# Altium project Smart-garden-pcb-V2.PrjPcb
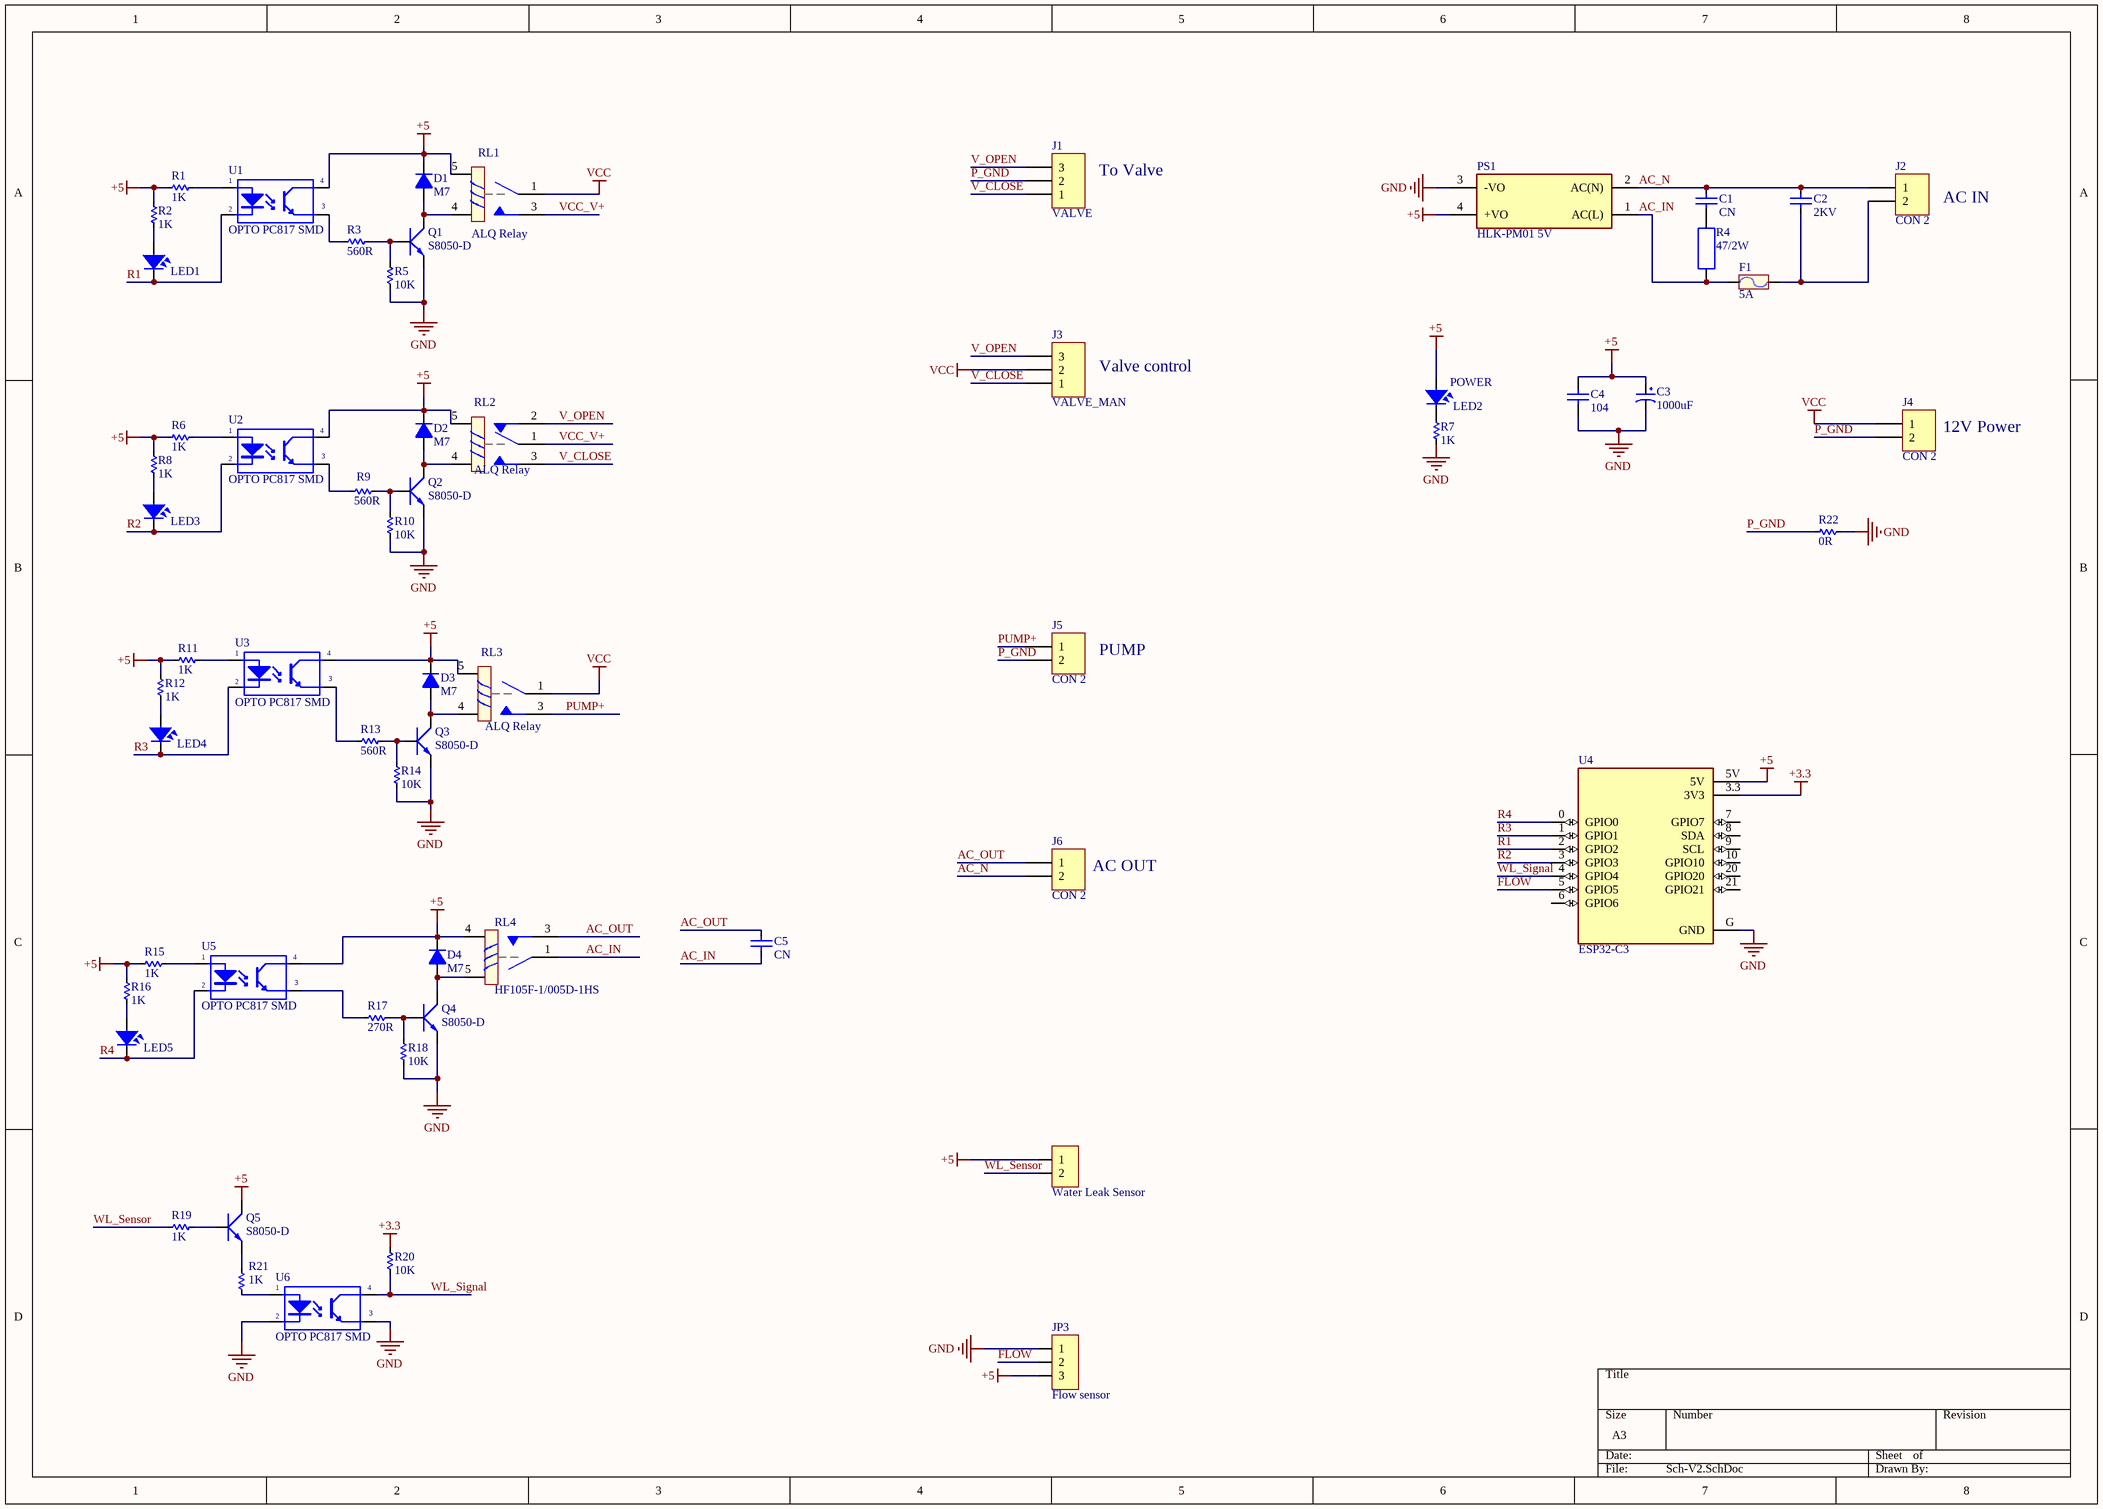
[diagram p0: Sch-V2.SchDoc]
1 sheet, 61 parts. Net scope: global (net labels, ports and power ports of the same name join across sheets).
Board file: PCB-V2.PcbDoc

## Sheet Sch-V2.SchDoc
size A3; SheetNumber: 1; SheetTotal: 1

### Parts
C1  CN  [Cap 10mm]
C2  2KV  [Cap 7.5mm]
C3  1000uF  [tu hoa 8mm]
C4  104  [tu 1206]
C5  CN  [Cap 10mm]
D1  M7  [DO-214AC]
D2  M7  [DO-214AC]
D3  M7  [DO-214AC]
D4  M7  [DO-214AC]
F1  5A  [Fuse rectangular]
J1  VALVE  [CON 3 2EDG5.08]
J2  CON 2  [CON 2 2EDG5.08]
J3  VALVE_MAN  [CON 3 2EDG5.08]
J4  CON 2  [CON 2 2EDG5.08]
J5  CON 2  [CON 2 2EDG5.08]
J6  CON 2  [CON 2 2EDG5.08]
JP2  Water Leak Sensor  [JP 1x2 CT]
JP3  Flow sensor  [JP 1x3 DT]
LED1  LED  [LED-0805-Red]  (value not drawn)
LED2  POWER  [LED-0805-Red]
LED3  LED  [LED-0805-Red]  (value not drawn)
LED4  LED  [LED-0805-Red]  (value not drawn)
LED5  LED  [LED-0805-Red]  (value not drawn)
PS1  HLK-PM01 5V  [CONV_HLK-5M05-5W]
Q1  S8050-D  [SOT23-321]
Q2  S8050-D  [SOT23-321]
Q3  S8050-D  [SOT23-321]
Q4  S8050-D  [SOT23-321]
Q5  S8050-D  [SOT23-321]
R1  1K  [RES-SMD-0805]
R2  1K  [RES-SMD-0805]
R3  560R  [RES-SMD-0805]
R4  47/2W  [R2WD]
R5  10K  [RES-SMD-0805]
R6  1K  [RES-SMD-0805]
R7  1K  [RES-SMD-0805]
R8  1K  [RES-SMD-0805]
R9  560R  [RES-SMD-0805]
R10  10K  [RES-SMD-0805]
R11  1K  [RES-SMD-0805]
R12  1K  [RES-SMD-0805]
R13  560R  [RES-SMD-0805]
R14  10K  [RES-SMD-0805]
R15  1K  [RES-SMD-0805]
R16  1K  [RES-SMD-0805]
R17  270R  [RES-SMD-0805]
R18  10K  [RES-SMD-0805]
R19  1K  [RES-SMD-0805]
R20  10K  [RES-SMD-0805]
R21  1K  [RES-SMD-0805]
R22  0R  [RES-SMD-0603]
RL1  ALQ Relay  [Relay-10A]
RL2  ALQ Relay  [Relay-LQ-form-C]
RL3  ALQ Relay  [Relay-10A]
RL4  HF105F-1/005D-1HS  [Relay-HF-30A-Form-A - duplicate]
U1  OPTO PC817 SMD  [SOP4]
U2  OPTO PC817 SMD  [SOP4]
U3  OPTO PC817 SMD  [SOP4]
U4  ESP32-C3  [ESP32-C3-PCP]
U5  OPTO PC817 SMD  [SOP4]
U6  OPTO PC817 SMD  [SOP4]

### Nets
+3.3: R20.1 U4.3.3(3V3)
+5: C3.1 C4.2 D1.2(K) D2.2(K) D3.2(K) D4.2(K) JP2.1 JP3.3 LED2.1 PS1.4(+VO) Q5.2(C) R1.2 R2.1 R6.2 R8.1 R11.2 R12.1 R15.2 R16.1 RL1.5 RL2.5 RL3.5 RL4.4 U1.4(C) U2.4(C) U3.4(C) U4.5V U5.4(C)
GND: C3.2 C4.1 JP3.1 PS1.3(-VO) Q1.1(E) Q2.1(E) Q3.1(E) Q4.1(E) R5.2 R7.2 R10.2 R14.2 R18.2 R22.2 U4.G(GND) U6.2(K) U6.3(E)
VCC: J3.2 J4.1 RL1.1 RL3.1
AC_IN: C5.1 F1.1 PS1.1(AC(L)) R4.2 RL4.1
AC_N: C1.2 C2.1 J2.1 J6.2 PS1.2(AC(N))
AC_OUT: C5.2 J6.1 RL4.3
FLOW: JP3.2 U4.5(GPIO5)
P_GND: J1.2 J4.2 J5.2 R22.1
PUMP+: J5.1 RL3.3
R1: LED1.2 U1.2(K) U4.2(GPIO2)
R2: LED3.2 U2.2(K) U4.3(GPIO3)
R3: LED4.2 U3.2(K) U4.1(GPIO1)
R4: LED5.2 U4.0(GPIO0) U5.2(K)
V_CLOSE: J1.1 J3.1 RL2.3
V_OPEN: J1.3 J3.3 RL2.2
VCC_V+: RL1.3 RL2.1
WL_Sensor: JP2.2 R19.1
WL_Signal: R20.2 U4.4(GPIO4) U6.4(C)
NetC1_1: C1.1 R4.1
NetC2_2: C2.2 F1.2 J2.2
NetD1_1: D1.1(A) Q1.2(C) RL1.4
NetD2_1: D2.1(A) Q2.2(C) RL2.4
NetD3_1: D3.1(A) Q3.2(C) RL3.4
NetD4_1: D4.1(A) Q4.2(C) RL4.5
NetLED1_1: LED1.1 R2.2
NetLED2_2: LED2.2 R7.1
NetLED3_1: LED3.1 R8.2
NetLED4_1: LED4.1 R12.2
NetLED5_1: LED5.1 R16.2
NetQ1_3: Q1.3(B) R3.2 R5.1
NetQ2_3: Q2.3(B) R9.2 R10.1
NetQ3_3: Q3.3(B) R13.2 R14.1
NetQ4_3: Q4.3(B) R17.1 R18.1
NetQ5_1: Q5.1(E) R21.1
NetQ5_3: Q5.3(B) R19.2
NetR1_1: R1.1 U1.1(A)
NetR3_1: R3.1 U1.3(E)
NetR6_1: R6.1 U2.1(A)
NetR9_1: R9.1 U2.3(E)
NetR11_1: R11.1 U3.1(A)
NetR13_1: R13.1 U3.3(E)
NetR15_1: R15.1 U5.1(A)
NetR17_2: R17.2 U5.3(E)
NetR21_2: R21.2 U6.1(A)

Not connected (* = marked no-connect by the designer): U4 6(GPIO6) 7(GPIO7) 8(SDA) 9(SCL) 10(GPIO10) 20(GPIO20) 21(GPIO21)

### Notes on the sheet
- (near J1) To Valve
- (near J2) AC IN
- (near J3) Valve control
- (near J4) 12V Power
- (near J5) PUMP
- (near J6) AC OUT

### Library data of the parts
C1 C5 = CN: Capacitor
C2 = Cap 103 2KV: Capacitor Ceramic 2KV
C3 = Tu Hoa 1000uF 16V 8x20: Cắm; Don_Vi: Con; So_Chan: 2; Ten_Linh_Kien: Tụ Hóa 1000uF 16V 8x20MM; Ma_Hang: MH008300; Chung_Loai: Cắm; Kieu_Chan: *
C4 = Tu 1206 104 50V 20%: Dán; Don_Vi: Con; So_Chan: 2; Ten_Linh_Kien: Tụ 1206 104-0.1uF 20% 50V; Ma_Hang: MH004544; Chung_Loai: Dán; Kieu_Chan: *
D1-D4 = Diode 1A: Diode 1A 1N4007 DO-41
F1 = Fuse: Designed by: VanDungEvn; Value: Fuse
J1 J3 = CON 3 EDG: CON3 KF terminal
J2 J4-J6 = CON 2 EDG: CON2 KF terminal
JP2 = JP 1x2 2.54 Cai Thang: Cắm; Ten_Linh_Kien: Jump Đơn Cái 2.54MM 1x20P Thẳng; Don_Vi: Con; Ma_Hang: MH004006; Ghi_Chu: *; Kieu_Chan: *; Chung_Loai: Cắm
JP3 = JP 1x3 2.54 Duc Thang: Cắm; Ten_Linh_Kien: Jump Đơn Đực 2.54MM 1x40P Thẳng 11MM; Don_Vi: Con; Ma_Hang: MH000903; Ghi_Chu: *; Kieu_Chan: *; Chung_Loai: Cắm
LED1-LED5 = LED SMD: Value: LED 3 - 5 ly 2 Colour
PS1 = CONV HLK-PM01: 220VAC to 5V
Q1-Q5 = S8050: S8050-D 25V 1.5A NPN 40V 0.5A NPN; ComponentLink1Description: Datasheet; ComponentLink1URL: https://www.alldatasheet.com/datasheet-pdf/view/433163/MCC/S8050-D.html; ComponentLink2Description: Datasheet2; ComponentLink2URL: https://www.onsemi.com/pdf/datasheet/ss8050-d.pdf
R1-R3 R5-R22 = Res-SMD: Resistor; Manufacturer: Generic Components; Class: Passive; Published: 08/06/2000; Publisher: Altium Hobart Technology Centre
R4 = R2W: Resistor 2W; Value: R2W - 47
RL1 RL3 = Relay 10A: ALQ Relay 10A or HF32F-G/005-HS; ComponentLink1Description: Datasheet; ComponentLink1URL: https://api.pim.na.industrial.panasonic.com/file_stream/main/fileversion/306
RL2 = Relay Panasonic LQ: ALQ105  10A; ComponentLink1Description: Datasheet; ComponentLink1URL: https://api.pim.na.industrial.panasonic.com/file_stream/main/fileversion/306
RL4 = Relay 10A 30A: HF-105 or HF32F-G/005-HS; ComponentLink1Description: Datasheet; ComponentLink1URL: https://api.pim.na.industrial.panasonic.com/file_stream/main/fileversion/306
U1-U3 U5 U6 = OPTO PC817 SMD: Single Opto; Value: PC817